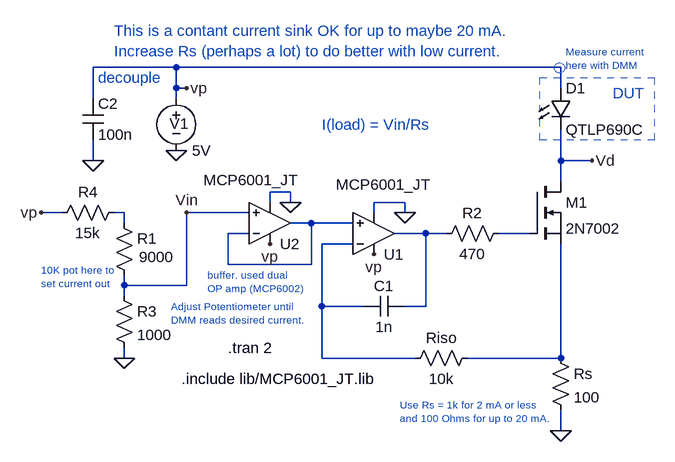
[diagram p0: schematic MCP6001_const_current.asc]
MCP6001_const_current.asc, the LTspice schematic file:
Version 4.1
SHEET 1 880 680
WIRE -96 -64 -224 -64
WIRE 496 -64 -96 -64
WIRE -96 -32 -96 -64
WIRE -80 -32 -96 -32
WIRE 496 -32 496 -64
WIRE -224 -16 -224 -64
WIRE -96 -16 -96 -32
WIRE -224 80 -224 48
WIRE 496 80 496 32
WIRE 544 80 496 80
WIRE 496 112 496 80
WIRE 80 128 48 128
WIRE 48 144 48 128
WIRE 80 144 80 128
WIRE 256 144 208 144
WIRE -272 160 -304 160
WIRE -176 160 -192 160
WIRE 16 160 -80 160
WIRE 208 160 208 144
WIRE 256 160 256 144
WIRE -176 176 -176 160
WIRE 112 176 80 176
WIRE 176 176 112 176
WIRE 16 192 -16 192
WIRE 288 192 240 192
WIRE 320 192 288 192
WIRE 448 192 400 192
WIRE 176 208 128 208
WIRE -16 240 -16 192
WIRE 112 240 112 176
WIRE 112 240 -16 240
WIRE -176 272 -176 256
WIRE -80 272 -80 160
WIRE -80 272 -176 272
WIRE -176 288 -176 272
WIRE 128 304 128 208
WIRE 192 304 128 304
WIRE 288 304 288 192
WIRE 288 304 256 304
WIRE -176 384 -176 368
WIRE 128 384 128 304
WIRE 272 384 128 384
WIRE 496 384 496 208
WIRE 496 384 352 384
WIRE 496 496 496 464
FLAG -96 64 0
FLAG 496 496 0
FLAG -80 -32 vp
FLAG 208 224 vp
FLAG 256 160 0
FLAG -80 160 Vin
FLAG 544 80 Vd
FLAG -224 80 0
FLAG 80 144 0
FLAG 48 208 vp
FLAG -176 384 0
FLAG -304 160 vp
SYMBOL voltage -96 -32 R0
WINDOW 123 0 0 Left 0
WINDOW 39 0 0 Left 0
WINDOW 0 -10 55 Left 2
SYMATTR InstName V1
SYMATTR Value 5V
SYMBOL res 480 368 R0
SYMATTR InstName Rs
SYMATTR Value 100
SYMBOL LED 480 -32 R0
SYMATTR InstName D1
SYMATTR Value QTLP690C
SYMBOL OpAmps\\opamp2 208 256 M180
WINDOW 3 -58 139 Left 2
SYMATTR Value MCP6001_JT
SYMATTR InstName U1
SYMBOL nmos 448 112 R0
SYMATTR InstName M1
SYMATTR Value 2N7002
SYMBOL res 416 176 R90
WINDOW 0 0 56 VBottom 2
WINDOW 3 32 56 VTop 2
SYMATTR InstName R2
SYMATTR Value 470
SYMBOL cap 256 288 R90
WINDOW 0 0 32 VBottom 2
WINDOW 3 32 32 VTop 2
SYMATTR InstName C1
SYMATTR Value 1n
SYMBOL res 368 368 R90
WINDOW 0 0 56 VBottom 2
WINDOW 3 32 56 VTop 2
SYMATTR InstName Riso
SYMATTR Value 10k
SYMBOL cap -240 -16 R0
SYMATTR InstName C2
SYMATTR Value 100n
SYMBOL OpAmps\\opamp2 48 240 M180
WINDOW 3 -102 130 Left 2
SYMATTR Value MCP6001_JT
SYMATTR InstName U2
SYMBOL res -192 160 R0
WINDOW 3 39 68 Left 2
SYMATTR InstName R1
SYMATTR Value 9000
SYMBOL res -192 272 R0
SYMATTR InstName R3
SYMATTR Value 1000
SYMBOL res -176 144 R90
WINDOW 0 0 56 VBottom 2
WINDOW 3 32 56 VTop 2
SYMATTR InstName R4
SYMATTR Value 15k
TEXT -88 416 Left 2 !.include lib/MCP6001_JT.lib
TEXT -16 368 Left 2 !.tran 2
TEXT 128 24 Left 2 ;I(load) = Vin/Rs
TEXT -216 -48 Left 2 ;decouple
TEXT -192 -120 Left 2 ;This is a contant current sink OK for up to maybe 20 mA.\nIncrease Rs (perhaps a lot) to do better with low current.
TEXT 248 456 Left 1 ;Use Rs = 1k for 2 mA or less\nand 100 Ohms for up to 20 mA.
TEXT 504 -88 Left 1 ;Measure current\nhere with DMM
TEXT -304 248 Left 1 ;10K pot here to\nset current out
TEXT 576 -24 Left 2 ;DUT
TEXT -48 256 Left 1 ;buffer. used dual\nOP amp (MCP6002)
TEXT -104 304 Left 1 ;Adjust Potentiometer until\nDMM reads desired current.
RECTANGLE Normal 640 48 464 -48 2
CIRCLE Normal 502 -71 486 -55 2

The netlist it stands for:
* MCP6001_const_current.asc
V1 vp 0 5V
Rs N006 0 100
D1 vp Vd QTLP690C
X§U1 N002 N005 vp 0 N003 MCP6001_JT  ; pins In+ In- V+ V- OUT
M1 Vd N004 N006 N006 2N7002
R2 N004 N003 470
C1 N003 N005 1n
Riso N006 N005 10k
C2 vp 0 100n
X§U2 Vin N002 vp 0 N002 MCP6001_JT  ; pins In+ In- V+ V- OUT
R1 N001 Vin 9000
R3 Vin 0 1000
R4 N001 vp 15k
.model D D
.lib standard.dio
.model NMOS NMOS
.model PMOS PMOS
.lib standard.mos
.include lib/MCP6001_JT.lib
.tran 2
* I(load) = Vin/Rs
* decouple
* This is a contant current sink OK for up to maybe 20 mA.
* Increase Rs (perhaps a lot) to do better with low current.
* Use Rs = 1k for 2 mA or less
* and 100 Ohms for up to 20 mA.
* Measure current
* here with DMM
* 10K pot here to
* set current out
* DUT
* buffer. used dual
* OP amp (MCP6002)
* Adjust Potentiometer until
* DMM reads desired current.
.backanno
.end